# Altium schematic sheet BATT_CHG_N_BMS.SchDoc
size A2; SheetNumber: 5; SheetTotal: 9
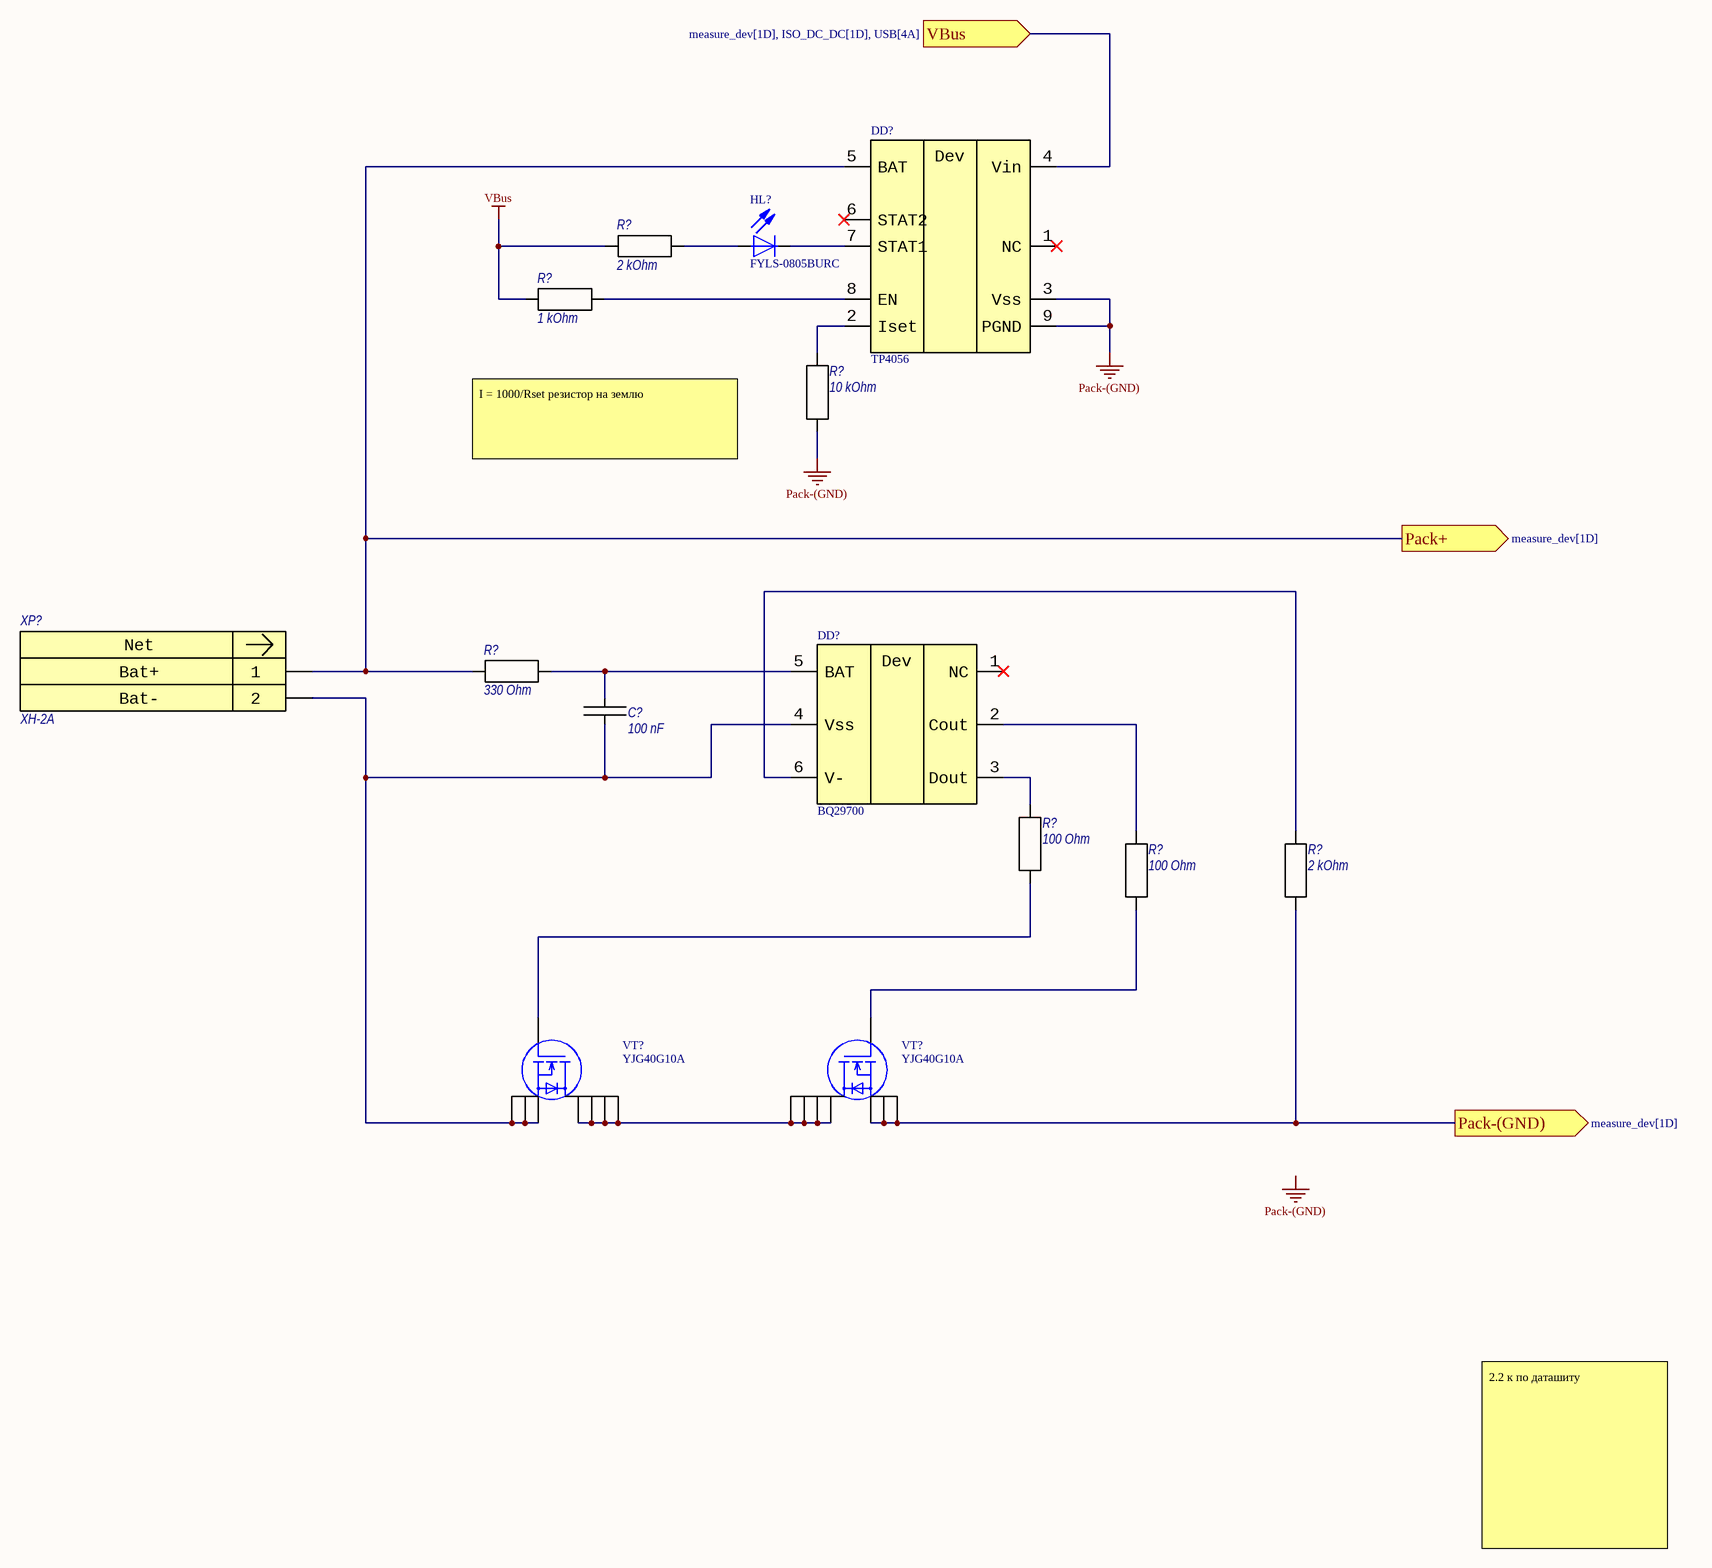
[diagram p0: BATT_CHG_N_BMS.SchDoc]

## Parts
(Parts that share a designator on the sheet are numbered #1, #2 ... from top to bottom, then left to right.)
C?  100 nF  [0603C]
DD?#1  TP4056  [SO-8_PowerPAD]
DD?#2  BQ29700  [WSON-6P-1.5X1.5]
HL?  FYLS-0805BURC  [0805LED]
R?#1  2 kOhm  [0603R]
R?#2  1 kOhm  [0603R]
R?#3  10 kOhm  [0603R]
R?#4  330 Ohm  [0603R]
R?#5  100 Ohm  [0603R]
R?#6  100 Ohm  [0603R]
R?#7  2 kOhm  [0603R]
VT?#1  YJG40G10A  [PDFN5060-8L]
VT?#2  YJG40G10A  [PDFN5060-8L]
XP?  XH-2A  [XH-2.54-2]

## Ports
Pack+ (out, see measure_dev[1D]), Pack-(GND) (out, see measure_dev[1D]), VBus (in, see measure_dev[1D], ISO_DC_DC[1D], USB[4A])

## Nets
Pack-(GND): DD?#1.3(Vss) DD?#1.9(PGND) R?#3.2
VBus: R?#1.2 R?#2.2
Pack+: DD?#1.5(BAT) R?#4.2 XP?.1 ; port Pack+
Pack-(GND): R?#7.2 VT?#2.1(S) VT?#2.2(S) VT?#2.3(S) ; port Pack-(GND)  [a separate net that carries the same name]
VBus: DD?#1.4(Vin) ; port VBus  [a separate net that carries the same name]
NetC?_1: C?.1 DD?#2.5(BAT) R?#4.1
NetC?_2: C?.2 DD?#2.4(Vss) VT?#1.1(S) VT?#1.2(S) VT?#1.3(S) XP?.2
NetDD?#1_2: DD?#1.2(Iset) R?#3.1
NetDD?#1_7: DD?#1.7(STAT1) HL?.2(K)
NetDD?#1_8: DD?#1.8(EN) R?#2.1
NetDD?#2_2: DD?#2.2(Cout) R?#6.1
NetDD?#2_3: DD?#2.3(Dout) R?#5.1
NetDD?#2_6: DD?#2.6(V-) R?#7.1
NetHL?_1: HL?.1(A) R?#1.1
NetR?#5_2: R?#5.2 VT?#1.4(G)
NetR?#6_2: R?#6.2 VT?#2.4(G)
NetVT?#1_5: VT?#1.5(D) VT?#1.6(D) VT?#1.7(D) VT?#1.8(D) VT?#2.5(D) VT?#2.6(D) VT?#2.7(D) VT?#2.8(D)

Not connected (* = marked no-connect by the designer): DD?#1 1(NC)* 6(STAT2)*; DD?#2 1(NC)*

## Notes on the sheet
- I = 1000/Rset резистор на землю
- 2.2 к по даташиту
- Labels drawn without touching a wire or pin: Pack-(GND)
- (in symbol BQ29700) Dev
- (in symbol TP4056) Dev
- (in symbol XH-2A) Net

## Library data of the parts
C? = CL10B104KB8NNN: Manufacturer: Samsung; Tolerance: 10%; Voltage: 50 V; Dielectric: X7R; Part Number: CL10B104KB8NNN; Package: 0603; Value: 100 nF
DD?#1 = TP4056: -; Manufacturer: UMW; Part Number: TP4056; Package: SO-8_PowerPAD; Type: Cell charger; Datasheet: https://static.chipdip.ru/lib/848/DOC018848830.pdf
DD?#2 = BQ29700: -; Manufacturer: TI; Part Number: BQ29700; Package: WSON-6P-1.5X1.5; Type: Cell protection ic; Datasheet: https://static.chipdip.ru/lib/213/DOC041213587.pdf
HL? = FYLS-0805BURC: Manufacturer: FORYARD; max Current: 30 mA; Color: RED; Type: SMD LED 0805 1 color; Part Number: FYLS-0805BURC; Package: 0805; Datasheet: https://www.elitan.ru/pdf/1/4/8/3/0/14830585.pdf
R?#1 R?#7 = RC0603FR-072KL: Manufacturer: Yageo; Tolerance: 1%; Power: 0.100 Watt; Part Number: RC0603FR-072KL; Package: 0603; Value: 2 kOhm
R?#2 = RC0603FR-071KL: Manufacturer: Yageo; Tolerance: 1%; Power: 0.100 Watt; Part Number: RC0603FR-071KL; Package: 0603; Value: 1 kOhm
R?#3 = RC0603FR-0710KL: Manufacturer: Yageo; Tolerance: 1%; Power: 0.100 Watt; Part Number: RC0603FR-0710KL; Package: 0603; Value: 10 kOhm
R?#4 = RC0603FR-07330RL: Manufacturer: Yageo; Tolerance: 1%; Power: 0.100 Watt; Part Number: RC0603FR-07330RL; Package: 0603; Value: 330 Ohm
R?#5 R?#6 = RC0603FR-07100RL: Manufacturer: Yageo; Tolerance: 1%; Power: 0.100 Watt; Part Number: RC0603FR-07100RL; Package: 0603; Value: 100 Ohm
VT?#1 VT?#2 = YJG40G10A: Manufacturer: Yangzhou Yangjie Electronic Technology; Type: N-chanel; max Ice/max Ids: 40 A; Max Ugs: +-20 V; Max Uds: 100 V; Max Rds: 21.5 mOhm; Part Number: YJG40G10A; Package: PDFN5060-8L; Min Ube: -; Max Uce: -; Min h21: -; Datasheet: https://static.chipdip.ru/lib/558/DOC045558825.pdf
XP? = XH-2A: Manufacturer: JST; Imax: 3 A; Umax: 250 V; Mating Connector: XH-2Y; pin1: Bat+; pin2: Bat-; pin3: ???; Part Number: XH-2A; Datasheet: www.digikey.es/en/resources/datasheets/jst/xh-connector?srsltid=AfmBOoo9sSFbM4Eu62APurDC7SwqQmd8KbPfwRIn_mEfewP-rqs9ANFl; pin4: ???; pin5: ???; pin6: ???; pin7: ???; pin8: ???; pin9: ???; pin10: ???; pin11: ???; pin12: ???; pin13: ???; pin14: ???; pin15: ???; pin16: ???; pin17: ???; pin18: ???; pin19: ???; pin20: ???; pin21: ???; pin22: ???; pin23: ???; pin24: ???; pin25: ???; pin26: ???; pin27: ???; pin28: ???; pin29: ???; pin30: ???; pin31: ???; pin32: ???; pin33: ???; pin34: ???; pin35: ???; pin36: ???; pin37: ???; pin38: ???; pin39: ???; pin40: ???; pin41: ???; pin42: ???; pin43: ???; pin44: ???; pin45: ???; pin46: ???; pin47: ???; pin48: ???; pin49: ???; pin50: ???